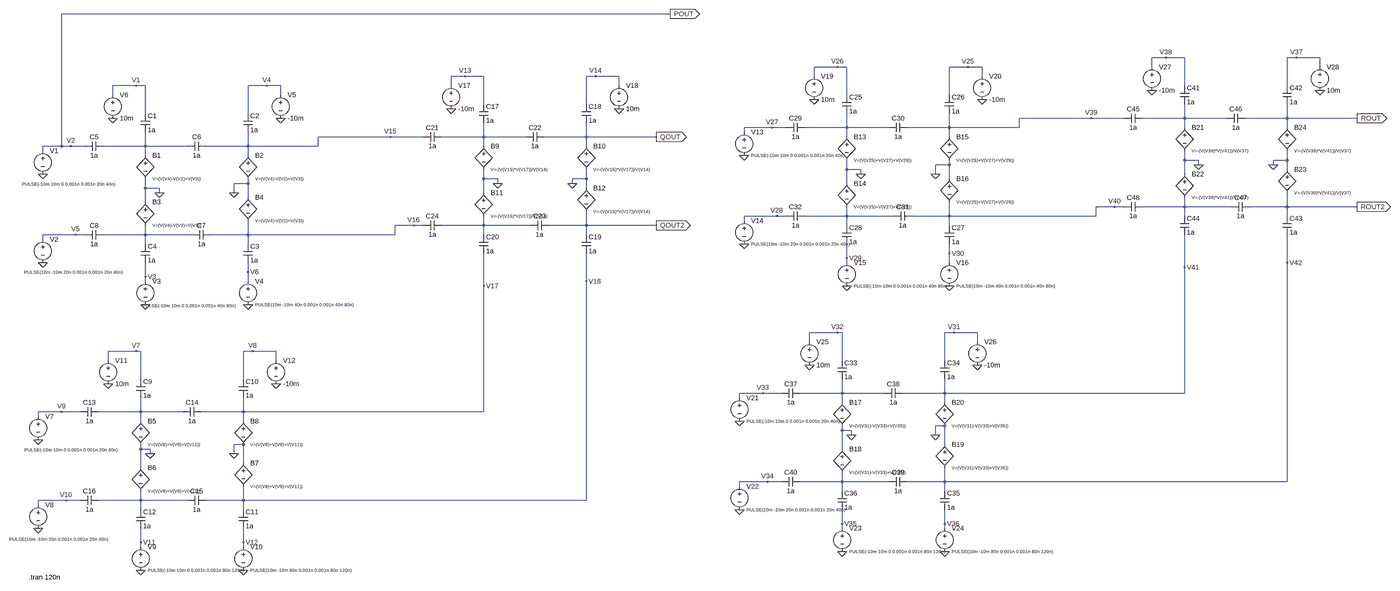
[diagram p0: schematic fredkin gate.asc, whole sheet]
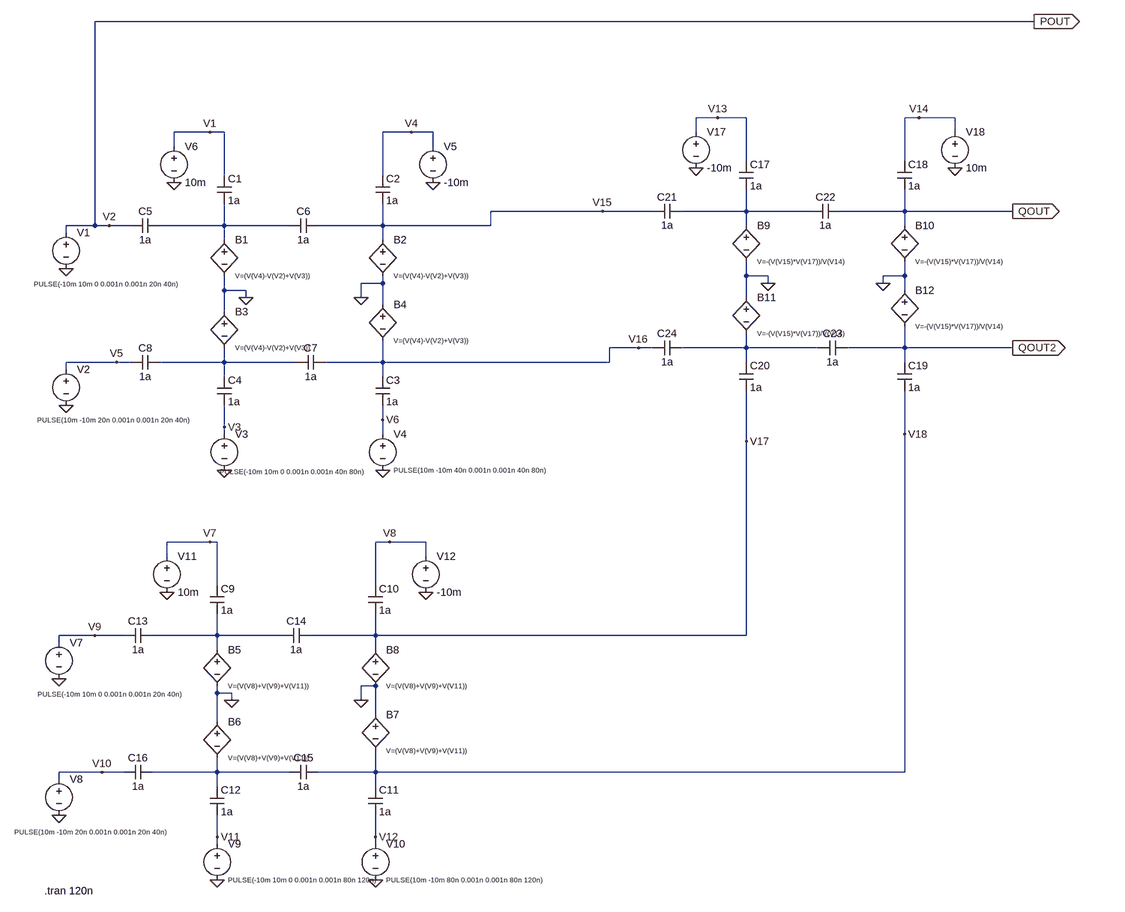
[diagram p1: schematic fredkin gate.asc, part, row 1 of 1, column 1 of 2]
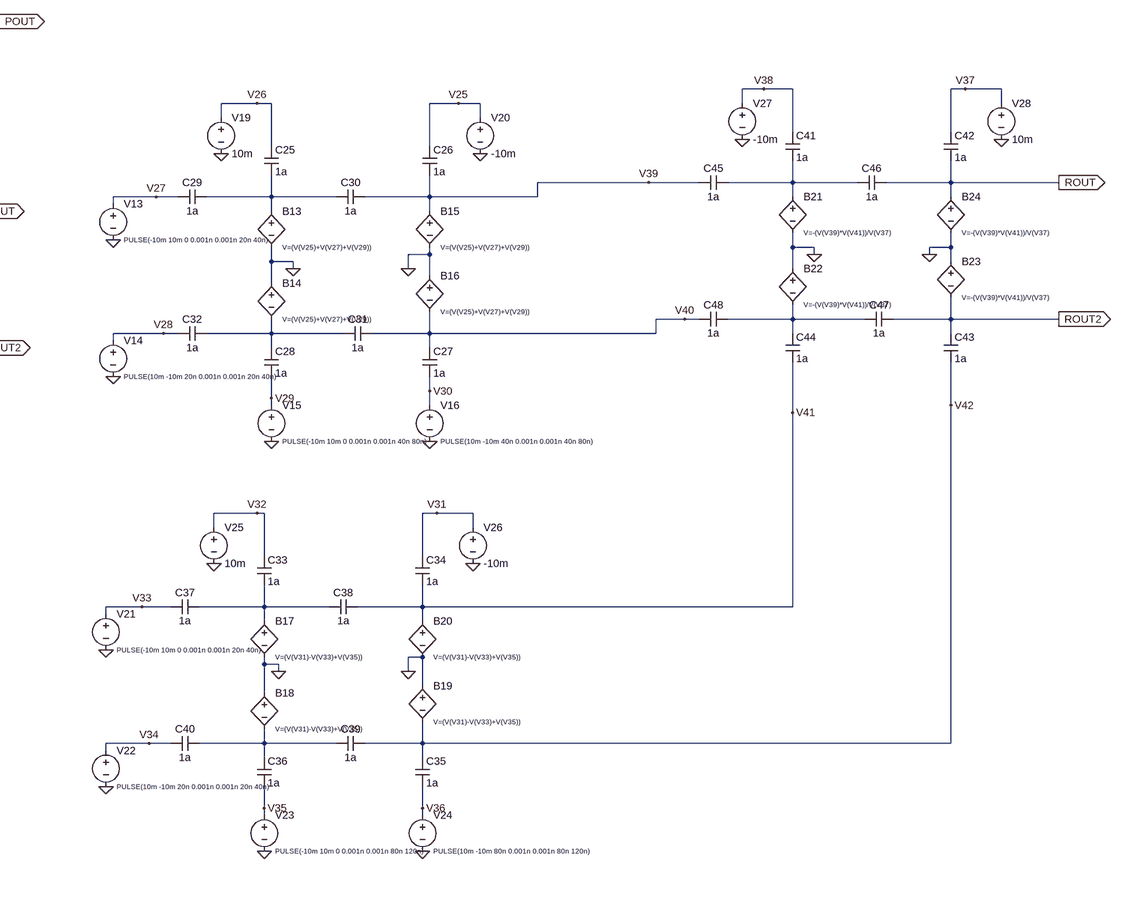
[diagram p2: schematic fredkin gate.asc, part, row 1 of 1, column 2 of 2]
fredkin gate.asc, the LTspice schematic file:
Version 4.1
SHEET 1 4316 1336
WIRE 1616 -784 -656 -784
WIRE 3520 -464 3472 -464
WIRE 3584 -464 3520 -464
WIRE 3968 -464 3936 -464
WIRE 4048 -464 3968 -464
WIRE 2208 -432 2128 -432
WIRE 2240 -432 2208 -432
WIRE 2656 -432 2592 -432
WIRE 2704 -432 2656 -432
WIRE 3472 -432 3472 -464
WIRE 4048 -432 4048 -464
WIRE 912 -400 864 -400
WIRE 976 -400 912 -400
WIRE 1360 -400 1328 -400
WIRE 1440 -400 1360 -400
WIRE 2128 -400 2128 -432
WIRE 2704 -400 2704 -432
WIRE -400 -368 -480 -368
WIRE -368 -368 -400 -368
WIRE 48 -368 -16 -368
WIRE 96 -368 48 -368
WIRE 864 -368 864 -400
WIRE 1440 -368 1440 -400
WIRE 3584 -368 3584 -464
WIRE 3936 -368 3936 -464
WIRE -480 -336 -480 -368
WIRE 96 -336 96 -368
WIRE 2240 -336 2240 -432
WIRE 2592 -336 2592 -432
WIRE 976 -304 976 -400
WIRE 1328 -304 1328 -400
WIRE -368 -272 -368 -368
WIRE -16 -272 -16 -368
WIRE 3264 -256 2832 -256
WIRE 3376 -256 3264 -256
WIRE 3584 -256 3584 -304
WIRE 3584 -256 3440 -256
WIRE 3728 -256 3584 -256
WIRE 3936 -256 3936 -304
WIRE 3936 -256 3792 -256
WIRE 4176 -256 3936 -256
WIRE 1984 -224 1888 -224
WIRE 2032 -224 1984 -224
WIRE 2240 -224 2240 -272
WIRE 2240 -224 2096 -224
WIRE 2384 -224 2240 -224
WIRE 2592 -224 2592 -272
WIRE 2592 -224 2448 -224
WIRE 2832 -224 2832 -256
WIRE 2832 -224 2592 -224
WIRE 3584 -224 3584 -256
WIRE 3936 -224 3936 -256
WIRE 1888 -208 1888 -224
WIRE 656 -192 224 -192
WIRE 768 -192 656 -192
WIRE 976 -192 976 -240
WIRE 976 -192 832 -192
WIRE 1120 -192 976 -192
WIRE 1328 -192 1328 -240
WIRE 1328 -192 1184 -192
WIRE 1568 -192 1328 -192
WIRE 2240 -192 2240 -224
WIRE 2592 -192 2592 -224
WIRE -656 -160 -656 -784
WIRE -656 -160 -720 -160
WIRE -624 -160 -656 -160
WIRE -576 -160 -624 -160
WIRE -368 -160 -368 -208
WIRE -368 -160 -512 -160
WIRE -224 -160 -368 -160
WIRE -16 -160 -16 -208
WIRE -16 -160 -160 -160
WIRE 224 -160 224 -192
WIRE 224 -160 -16 -160
WIRE 976 -160 976 -192
WIRE 1328 -160 1328 -192
WIRE -720 -144 -720 -160
WIRE -368 -128 -368 -160
WIRE -16 -128 -16 -160
WIRE 3584 -112 3584 -144
WIRE 3632 -112 3584 -112
WIRE 3936 -112 3936 -144
WIRE 3936 -112 3888 -112
WIRE 2592 -96 2592 -112
WIRE 2592 -96 2544 -96
WIRE 3632 -96 3632 -112
WIRE 3888 -96 3888 -112
WIRE 2240 -80 2240 -112
WIRE 2288 -80 2240 -80
WIRE 3936 -80 3936 -112
WIRE 2288 -64 2288 -80
WIRE 2544 -64 2544 -96
WIRE 3584 -64 3584 -112
WIRE 976 -48 976 -80
WIRE 1024 -48 976 -48
WIRE 1328 -48 1328 -80
WIRE 1328 -48 1280 -48
WIRE 2592 -48 2592 -96
WIRE -16 -32 -16 -48
WIRE -16 -32 -64 -32
WIRE 1024 -32 1024 -48
WIRE 1280 -32 1280 -48
WIRE 2240 -32 2240 -80
WIRE -368 -16 -368 -48
WIRE -320 -16 -368 -16
WIRE 1328 -16 1328 -48
WIRE -320 0 -320 -16
WIRE -64 0 -64 -32
WIRE 976 0 976 -48
WIRE -16 16 -16 -32
WIRE -368 32 -368 -16
WIRE 3344 48 3280 48
WIRE 3376 48 3344 48
WIRE 3584 48 3584 16
WIRE 3584 48 3440 48
WIRE 3744 48 3584 48
WIRE 3936 48 3936 0
WIRE 3936 48 3808 48
WIRE 4176 48 3936 48
WIRE 2000 80 1888 80
WIRE 2032 80 2000 80
WIRE 2240 80 2240 48
WIRE 2240 80 2096 80
WIRE 2400 80 2240 80
WIRE 2592 80 2592 32
WIRE 2592 80 2464 80
WIRE 3280 80 3280 48
WIRE 3280 80 2592 80
WIRE 3584 80 3584 48
WIRE 3936 80 3936 48
WIRE 1888 96 1888 80
WIRE 736 112 672 112
WIRE 768 112 736 112
WIRE 976 112 976 80
WIRE 976 112 832 112
WIRE 1136 112 976 112
WIRE 1328 112 1328 64
WIRE 1328 112 1200 112
WIRE 1568 112 1328 112
WIRE 2240 112 2240 80
WIRE 2592 112 2592 80
WIRE -608 144 -720 144
WIRE -576 144 -608 144
WIRE -368 144 -368 112
WIRE -368 144 -512 144
WIRE -208 144 -368 144
WIRE -16 144 -16 96
WIRE -16 144 -144 144
WIRE 672 144 672 112
WIRE 672 144 -16 144
WIRE 976 144 976 112
WIRE 1328 144 1328 112
WIRE -720 160 -720 144
WIRE -368 176 -368 144
WIRE -16 176 -16 144
WIRE 2592 208 2592 176
WIRE 2240 224 2240 176
WIRE 2240 240 2240 224
WIRE 2592 240 2592 208
WIRE 3936 240 3936 144
WIRE 3584 256 3584 144
WIRE -16 272 -16 240
WIRE -368 288 -368 240
WIRE -368 304 -368 288
WIRE -16 304 -16 272
WIRE 1328 304 1328 208
WIRE 976 320 976 208
WIRE 2208 480 2112 480
WIRE 2224 480 2208 480
WIRE 2608 480 2576 480
WIRE 2688 480 2608 480
WIRE 2112 512 2112 480
WIRE 2688 512 2688 480
WIRE -400 544 -496 544
WIRE -384 544 -400 544
WIRE 0 544 -32 544
WIRE 80 544 0 544
WIRE -496 576 -496 544
WIRE 80 576 80 544
WIRE 2224 576 2224 480
WIRE 2576 576 2576 480
WIRE -384 640 -384 544
WIRE -32 640 -32 544
WIRE 1952 688 1872 688
WIRE 2016 688 1952 688
WIRE 2224 688 2224 640
WIRE 2224 688 2080 688
WIRE 2368 688 2224 688
WIRE 2576 688 2576 640
WIRE 2576 688 2432 688
WIRE 3584 688 3584 256
WIRE 3584 688 2576 688
WIRE 1872 704 1872 688
WIRE 2224 720 2224 688
WIRE 2576 720 2576 688
WIRE -656 752 -736 752
WIRE -592 752 -656 752
WIRE -384 752 -384 704
WIRE -384 752 -528 752
WIRE -240 752 -384 752
WIRE -32 752 -32 704
WIRE -32 752 -176 752
WIRE 976 752 976 320
WIRE 976 752 -32 752
WIRE -736 768 -736 752
WIRE -384 784 -384 752
WIRE -32 784 -32 752
WIRE 2576 800 2544 800
WIRE 2224 816 2224 800
WIRE 2256 816 2224 816
WIRE 2256 832 2256 816
WIRE 2544 832 2544 800
WIRE -32 864 -64 864
WIRE 2576 864 2576 800
WIRE -384 880 -384 864
WIRE -352 880 -384 880
WIRE 2224 880 2224 816
WIRE -352 896 -352 880
WIRE -64 896 -64 864
WIRE -32 928 -32 864
WIRE -384 944 -384 880
WIRE 1968 992 1872 992
WIRE 2016 992 1968 992
WIRE 2224 992 2224 960
WIRE 2224 992 2080 992
WIRE 2384 992 2224 992
WIRE 2576 992 2576 944
WIRE 2576 992 2448 992
WIRE 3936 992 3936 240
WIRE 3936 992 2576 992
WIRE 1872 1008 1872 992
WIRE 2224 1024 2224 992
WIRE 2576 1024 2576 992
WIRE -640 1056 -736 1056
WIRE -592 1056 -640 1056
WIRE -384 1056 -384 1024
WIRE -384 1056 -528 1056
WIRE -224 1056 -384 1056
WIRE -32 1056 -32 1008
WIRE -32 1056 -160 1056
WIRE 1328 1056 1328 304
WIRE 1328 1056 -32 1056
WIRE -736 1072 -736 1056
WIRE -384 1088 -384 1056
WIRE -32 1088 -32 1056
WIRE 2224 1136 2224 1088
WIRE 2576 1136 2576 1088
WIRE 2224 1152 2224 1136
WIRE 2576 1152 2576 1136
WIRE -384 1200 -384 1152
WIRE -32 1200 -32 1152
WIRE -384 1216 -384 1200
WIRE -32 1216 -32 1200
FLAG -480 -256 0
FLAG -720 -64 0
FLAG -720 240 0
FLAG -368 384 0
FLAG -16 384 0
FLAG 96 -256 0
FLAG -400 -368 V1
FLAG -624 -160 V2
FLAG -608 144 V5
FLAG -368 288 V3
FLAG -16 272 V6
FLAG 48 -368 V4
FLAG -496 656 0
FLAG -736 848 0
FLAG -736 1152 0
FLAG -384 1296 0
FLAG -32 1296 0
FLAG 80 656 0
FLAG 864 -288 0
FLAG 1440 -288 0
FLAG 1568 -192 QOUT
IOPIN 1568 -192 Out
FLAG 1568 112 QOUT2
IOPIN 1568 112 Out
FLAG -400 544 V7
FLAG 0 544 V8
FLAG -656 752 V9
FLAG -640 1056 V10
FLAG -384 1200 V11
FLAG -32 1200 V12
FLAG 912 -400 V13
FLAG 1360 -400 V14
FLAG 656 -192 V15
FLAG 736 112 V16
FLAG 976 320 V17
FLAG 1328 304 V18
FLAG -320 0 0
FLAG -64 0 0
FLAG 1024 -32 0
FLAG 1280 -32 0
FLAG -352 896 0
FLAG -64 896 0
FLAG 2128 -320 0
FLAG 1888 -128 0
FLAG 1888 176 0
FLAG 2240 320 0
FLAG 2592 320 0
FLAG 2704 -320 0
FLAG 2208 -432 V26
FLAG 1984 -224 V27
FLAG 2000 80 V28
FLAG 2240 224 V29
FLAG 2592 208 V30
FLAG 2656 -432 V25
FLAG 2112 592 0
FLAG 1872 784 0
FLAG 1872 1088 0
FLAG 2224 1232 0
FLAG 2576 1232 0
FLAG 2688 592 0
FLAG 3472 -352 0
FLAG 4048 -352 0
FLAG 4176 -256 ROUT
IOPIN 4176 -256 Out
FLAG 4176 48 ROUT2
IOPIN 4176 48 Out
FLAG 2208 480 V32
FLAG 2608 480 V31
FLAG 1952 688 V33
FLAG 1968 992 V34
FLAG 2224 1136 V35
FLAG 2576 1136 V36
FLAG 3520 -464 V38
FLAG 3968 -464 V37
FLAG 3264 -256 V39
FLAG 3344 48 V40
FLAG 3584 256 V41
FLAG 3936 240 V42
FLAG 2288 -64 0
FLAG 2544 -64 0
FLAG 3632 -96 0
FLAG 3888 -96 0
FLAG 2256 832 0
FLAG 2544 832 0
FLAG 1616 -784 POUT
IOPIN 1616 -784 Out
SYMBOL bv -368 -144 R0
WINDOW 3 24 96 Left 1
SYMATTR Value V=(V(V4)-V(V2)+V(V3))
SYMATTR InstName B1
SYMBOL bv -16 -144 R0
WINDOW 3 24 96 Left 1
SYMATTR Value V=(V(V4)-V(V2)+V(V3))
SYMATTR InstName B2
SYMBOL bv -368 16 R0
WINDOW 3 24 96 Left 1
SYMATTR Value V=(V(V4)-V(V2)+V(V3))
SYMATTR InstName B3
SYMBOL bv -16 0 R0
WINDOW 3 24 96 Left 1
SYMATTR Value V=(V(V4)-V(V2)+V(V3))
SYMATTR InstName B4
SYMBOL cap -384 -272 R0
SYMATTR InstName C1
SYMATTR Value 1a
SYMBOL cap -32 -272 R0
SYMATTR InstName C2
SYMATTR Value 1a
SYMBOL cap -32 176 R0
SYMATTR InstName C3
SYMATTR Value 1a
SYMBOL cap -384 176 R0
SYMATTR InstName C4
SYMATTR Value 1a
SYMBOL cap -512 -176 R90
WINDOW 0 0 32 VBottom 2
WINDOW 3 32 32 VTop 2
SYMATTR InstName C5
SYMATTR Value 1a
SYMBOL cap -160 -176 R90
WINDOW 0 0 32 VBottom 2
WINDOW 3 32 32 VTop 2
SYMATTR InstName C6
SYMATTR Value 1a
SYMBOL cap -144 128 R90
WINDOW 0 0 32 VBottom 2
WINDOW 3 32 32 VTop 2
SYMATTR InstName C7
SYMATTR Value 1a
SYMBOL cap -512 128 R90
WINDOW 0 0 32 VBottom 2
WINDOW 3 32 32 VTop 2
SYMATTR InstName C8
SYMATTR Value 1a
SYMBOL voltage -720 -160 R0
WINDOW 3 -72 130 Left 1
WINDOW 123 0 0 Left 0
WINDOW 39 0 0 Left 0
SYMATTR Value PULSE(-10m 10m 0 0.001n 0.001n 20n 40n)
SYMATTR InstName V1
SYMBOL voltage -720 144 R0
WINDOW 3 -64 129 Left 1
WINDOW 123 0 0 Left 0
WINDOW 39 0 0 Left 0
SYMATTR Value PULSE(10m -10m 20n 0.001n 0.001n 20n 40n)
SYMATTR InstName V2
SYMBOL voltage -368 288 R0
WINDOW 3 -10 100 Left 1
WINDOW 123 0 0 Left 0
WINDOW 39 0 0 Left 0
SYMATTR Value PULSE(-10m 10m 0 0.001n 0.001n 40n 80n)
SYMATTR InstName V3
SYMBOL voltage -16 288 R0
WINDOW 3 24 96 Left 1
WINDOW 123 0 0 Left 0
WINDOW 39 0 0 Left 0
SYMATTR Value PULSE(10m -10m 40n 0.001n 0.001n 40n 80n)
SYMATTR InstName V4
SYMBOL voltage -480 -352 R0
WINDOW 123 0 0 Left 0
WINDOW 39 0 0 Left 0
SYMATTR InstName V6
SYMATTR Value 10m
SYMBOL voltage 96 -352 R0
WINDOW 123 0 0 Left 0
WINDOW 39 0 0 Left 0
SYMATTR InstName V5
SYMATTR Value -10m
SYMBOL bv -384 768 R0
WINDOW 3 24 96 Left 1
SYMATTR Value V=(V(V8)+V(V9)+V(V11))
SYMATTR InstName B5
SYMBOL cap -400 640 R0
SYMATTR InstName C9
SYMATTR Value 1a
SYMBOL cap -48 640 R0
SYMATTR InstName C10
SYMATTR Value 1a
SYMBOL cap -48 1088 R0
SYMATTR InstName C11
SYMATTR Value 1a
SYMBOL cap -400 1088 R0
SYMATTR InstName C12
SYMATTR Value 1a
SYMBOL cap -528 736 R90
WINDOW 0 0 32 VBottom 2
WINDOW 3 32 32 VTop 2
SYMATTR InstName C13
SYMATTR Value 1a
SYMBOL cap -176 736 R90
WINDOW 0 0 32 VBottom 2
WINDOW 3 32 32 VTop 2
SYMATTR InstName C14
SYMATTR Value 1a
SYMBOL cap -160 1040 R90
WINDOW 0 0 32 VBottom 2
WINDOW 3 32 32 VTop 2
SYMATTR InstName C15
SYMATTR Value 1a
SYMBOL cap -528 1040 R90
WINDOW 0 0 32 VBottom 2
WINDOW 3 32 32 VTop 2
SYMATTR InstName C16
SYMATTR Value 1a
SYMBOL voltage -736 752 R0
WINDOW 3 -47 131 Left 1
WINDOW 123 0 0 Left 0
WINDOW 39 0 0 Left 0
SYMATTR Value PULSE(-10m 10m 0 0.001n 0.001n 20n 40n)
SYMATTR InstName V7
SYMBOL voltage -736 1056 R0
WINDOW 3 -99 133 Left 1
WINDOW 123 0 0 Left 0
WINDOW 39 0 0 Left 0
SYMATTR Value PULSE(10m -10m 20n 0.001n 0.001n 20n 40n)
SYMATTR InstName V8
SYMBOL voltage -384 1200 R0
WINDOW 3 24 96 Left 1
WINDOW 123 0 0 Left 0
WINDOW 39 0 0 Left 0
SYMATTR Value PULSE(-10m 10m 0 0.001n 0.001n 80n 120n)
SYMATTR InstName V9
SYMBOL voltage -32 1200 R0
WINDOW 3 24 96 Left 1
WINDOW 123 0 0 Left 0
WINDOW 39 0 0 Left 0
SYMATTR Value PULSE(10m -10m 80n 0.001n 0.001n 80n 120n)
SYMATTR InstName V10
SYMBOL voltage -496 560 R0
WINDOW 123 0 0 Left 0
WINDOW 39 0 0 Left 0
SYMATTR InstName V11
SYMATTR Value 10m
SYMBOL voltage 80 560 R0
WINDOW 123 0 0 Left 0
WINDOW 39 0 0 Left 0
SYMATTR InstName V12
SYMATTR Value -10m
SYMBOL bv 976 -176 R0
WINDOW 3 24 96 Left 1
SYMATTR Value V=-(V(V15)*V(V17))/V(V14)
SYMATTR InstName B9
SYMBOL bv 1328 -176 R0
WINDOW 3 24 96 Left 1
SYMATTR Value V=-(V(V15)*V(V17))/V(V14)
SYMATTR InstName B10
SYMBOL bv 976 -16 R0
WINDOW 3 24 96 Left 1
SYMATTR Value V=-(V(V15)*V(V17))/V(V14)
SYMATTR InstName B11
SYMBOL bv 1328 -32 R0
WINDOW 3 24 96 Left 1
SYMATTR Value V=-(V(V15)*V(V17))/V(V14)
SYMATTR InstName B12
SYMBOL cap 960 -304 R0
SYMATTR InstName C17
SYMATTR Value 1a
SYMBOL cap 1312 -304 R0
SYMATTR InstName C18
SYMATTR Value 1a
SYMBOL cap 1312 144 R0
SYMATTR InstName C19
SYMATTR Value 1a
SYMBOL cap 960 144 R0
SYMATTR InstName C20
SYMATTR Value 1a
SYMBOL cap 832 -208 R90
WINDOW 0 0 32 VBottom 2
WINDOW 3 32 32 VTop 2
SYMATTR InstName C21
SYMATTR Value 1a
SYMBOL cap 1184 -208 R90
WINDOW 0 0 32 VBottom 2
WINDOW 3 32 32 VTop 2
SYMATTR InstName C22
SYMATTR Value 1a
SYMBOL cap 1200 96 R90
WINDOW 0 0 32 VBottom 2
WINDOW 3 32 32 VTop 2
SYMATTR InstName C23
SYMATTR Value 1a
SYMBOL cap 832 96 R90
WINDOW 0 0 32 VBottom 2
WINDOW 3 32 32 VTop 2
SYMATTR InstName C24
SYMATTR Value 1a
SYMBOL voltage 864 -384 R0
WINDOW 123 0 0 Left 0
WINDOW 39 0 0 Left 0
SYMATTR InstName V17
SYMATTR Value -10m
SYMBOL voltage 1440 -384 R0
WINDOW 123 0 0 Left 0
WINDOW 39 0 0 Left 0
SYMATTR InstName V18
SYMATTR Value 10m
SYMBOL bv 2240 -208 R0
WINDOW 3 24 96 Left 1
SYMATTR Value V=(V(V25)+V(V27)+V(V29))
SYMATTR InstName B13
SYMBOL cap 2224 -336 R0
SYMATTR InstName C25
SYMATTR Value 1a
SYMBOL cap 2576 -336 R0
SYMATTR InstName C26
SYMATTR Value 1a
SYMBOL cap 2576 112 R0
SYMATTR InstName C27
SYMATTR Value 1a
SYMBOL cap 2224 112 R0
SYMATTR InstName C28
SYMATTR Value 1a
SYMBOL cap 2096 -240 R90
WINDOW 0 0 32 VBottom 2
WINDOW 3 32 32 VTop 2
SYMATTR InstName C29
SYMATTR Value 1a
SYMBOL cap 2448 -240 R90
WINDOW 0 0 32 VBottom 2
WINDOW 3 32 32 VTop 2
SYMATTR InstName C30
SYMATTR Value 1a
SYMBOL cap 2464 64 R90
WINDOW 0 0 32 VBottom 2
WINDOW 3 32 32 VTop 2
SYMATTR InstName C31
SYMATTR Value 1a
SYMBOL cap 2096 64 R90
WINDOW 0 0 32 VBottom 2
WINDOW 3 32 32 VTop 2
SYMATTR InstName C32
SYMATTR Value 1a
SYMBOL voltage 1888 -224 R0
WINDOW 3 24 96 Left 1
WINDOW 123 0 0 Left 0
WINDOW 39 0 0 Left 0
SYMATTR Value PULSE(-10m 10m 0 0.001n 0.001n 20n 40n)
SYMATTR InstName V13
SYMBOL voltage 1888 80 R0
WINDOW 3 24 96 Left 1
WINDOW 123 0 0 Left 0
WINDOW 39 0 0 Left 0
SYMATTR Value PULSE(10m -10m 20n 0.001n 0.001n 20n 40n)
SYMATTR InstName V14
SYMBOL voltage 2240 224 R0
WINDOW 3 24 96 Left 1
WINDOW 123 0 0 Left 0
WINDOW 39 0 0 Left 0
SYMATTR Value PULSE(-10m 10m 0 0.001n 0.001n 40n 80n)
SYMATTR InstName V15
SYMBOL voltage 2592 224 R0
WINDOW 3 24 96 Left 1
WINDOW 123 0 0 Left 0
WINDOW 39 0 0 Left 0
SYMATTR Value PULSE(10m -10m 40n 0.001n 0.001n 40n 80n)
SYMATTR InstName V16
SYMBOL voltage 2128 -416 R0
WINDOW 123 0 0 Left 0
WINDOW 39 0 0 Left 0
SYMATTR InstName V19
SYMATTR Value 10m
SYMBOL voltage 2704 -416 R0
WINDOW 123 0 0 Left 0
WINDOW 39 0 0 Left 0
SYMATTR InstName V20
SYMATTR Value -10m
SYMBOL bv 2224 704 R0
WINDOW 3 24 96 Left 1
SYMATTR Value V=(V(V31)-V(V33)+V(V35))
SYMATTR InstName B17
SYMBOL cap 2208 576 R0
SYMATTR InstName C33
SYMATTR Value 1a
SYMBOL cap 2560 576 R0
SYMATTR InstName C34
SYMATTR Value 1a
SYMBOL cap 2560 1024 R0
SYMATTR InstName C35
SYMATTR Value 1a
SYMBOL cap 2208 1024 R0
SYMATTR InstName C36
SYMATTR Value 1a
SYMBOL cap 2080 672 R90
WINDOW 0 0 32 VBottom 2
WINDOW 3 32 32 VTop 2
SYMATTR InstName C37
SYMATTR Value 1a
SYMBOL cap 2432 672 R90
WINDOW 0 0 32 VBottom 2
WINDOW 3 32 32 VTop 2
SYMATTR InstName C38
SYMATTR Value 1a
SYMBOL cap 2448 976 R90
WINDOW 0 0 32 VBottom 2
WINDOW 3 32 32 VTop 2
SYMATTR InstName C39
SYMATTR Value 1a
SYMBOL cap 2080 976 R90
WINDOW 0 0 32 VBottom 2
WINDOW 3 32 32 VTop 2
SYMATTR InstName C40
SYMATTR Value 1a
SYMBOL voltage 1872 688 R0
WINDOW 3 24 96 Left 1
WINDOW 123 0 0 Left 0
WINDOW 39 0 0 Left 0
SYMATTR Value PULSE(-10m 10m 0 0.001n 0.001n 20n 40n)
SYMATTR InstName V21
SYMBOL voltage 1872 992 R0
WINDOW 3 24 96 Left 1
WINDOW 123 0 0 Left 0
WINDOW 39 0 0 Left 0
SYMATTR Value PULSE(10m -10m 20n 0.001n 0.001n 20n 40n)
SYMATTR InstName V22
SYMBOL voltage 2224 1136 R0
WINDOW 3 24 96 Left 1
WINDOW 123 0 0 Left 0
WINDOW 39 0 0 Left 0
SYMATTR Value PULSE(-10m 10m 0 0.001n 0.001n 80n 120n)
SYMATTR InstName V23
SYMBOL voltage 2576 1136 R0
WINDOW 3 24 96 Left 1
WINDOW 123 0 0 Left 0
WINDOW 39 0 0 Left 0
SYMATTR Value PULSE(10m -10m 80n 0.001n 0.001n 80n 120n)
SYMATTR InstName V24
SYMBOL voltage 2112 496 R0
WINDOW 123 0 0 Left 0
WINDOW 39 0 0 Left 0
SYMATTR InstName V25
SYMATTR Value 10m
SYMBOL voltage 2688 496 R0
WINDOW 123 0 0 Left 0
WINDOW 39 0 0 Left 0
SYMATTR InstName V26
SYMATTR Value -10m
SYMBOL bv 3584 -240 R0
WINDOW 3 24 96 Left 1
SYMATTR Value V=-(V(V39)*V(V41))/V(V37)
SYMATTR InstName B21
SYMBOL cap 3568 -368 R0
SYMATTR InstName C41
SYMATTR Value 1a
SYMBOL cap 3920 -368 R0
SYMATTR InstName C42
SYMATTR Value 1a
SYMBOL cap 3920 80 R0
SYMATTR InstName C43
SYMATTR Value 1a
SYMBOL cap 3568 80 R0
SYMATTR InstName C44
SYMATTR Value 1a
SYMBOL cap 3440 -272 R90
WINDOW 0 0 32 VBottom 2
WINDOW 3 32 32 VTop 2
SYMATTR InstName C45
SYMATTR Value 1a
SYMBOL cap 3792 -272 R90
WINDOW 0 0 32 VBottom 2
WINDOW 3 32 32 VTop 2
SYMATTR InstName C46
SYMATTR Value 1a
SYMBOL cap 3808 32 R90
WINDOW 0 0 32 VBottom 2
WINDOW 3 32 32 VTop 2
SYMATTR InstName C47
SYMATTR Value 1a
SYMBOL cap 3440 32 R90
WINDOW 0 0 32 VBottom 2
WINDOW 3 32 32 VTop 2
SYMATTR InstName C48
SYMATTR Value 1a
SYMBOL voltage 3472 -448 R0
WINDOW 123 0 0 Left 0
WINDOW 39 0 0 Left 0
SYMATTR InstName V27
SYMATTR Value -10m
SYMBOL voltage 4048 -448 R0
WINDOW 123 0 0 Left 0
WINDOW 39 0 0 Left 0
SYMATTR InstName V28
SYMATTR Value 10m
SYMBOL bv -384 928 R0
WINDOW 3 24 96 Left 1
SYMATTR Value V=(V(V8)+V(V9)+V(V11))
SYMATTR InstName B6
SYMBOL bv -32 912 R0
WINDOW 3 24 96 Left 1
SYMATTR Value V=(V(V8)+V(V9)+V(V11))
SYMATTR InstName B7
SYMBOL bv -32 768 R0
WINDOW 3 24 96 Left 1
SYMATTR Value V=(V(V8)+V(V9)+V(V11))
SYMATTR InstName B8
SYMBOL bv 2240 -48 R0
WINDOW 3 24 96 Left 1
SYMATTR Value V=(V(V25)+V(V27)+V(V29))
SYMATTR InstName B14
SYMBOL bv 2592 -208 R0
WINDOW 3 24 96 Left 1
SYMATTR Value V=(V(V25)+V(V27)+V(V29))
SYMATTR InstName B15
SYMBOL bv 2592 -64 R0
WINDOW 3 24 96 Left 1
SYMATTR Value V=(V(V25)+V(V27)+V(V29))
SYMATTR InstName B16
SYMBOL bv 2224 864 R0
WINDOW 3 24 96 Left 1
SYMATTR Value V=(V(V31)-V(V33)+V(V35))
SYMATTR InstName B18
SYMBOL bv 2576 848 R0
WINDOW 3 24 96 Left 1
SYMATTR Value V=(V(V31)-V(V33)+V(V35))
SYMATTR InstName B19
SYMBOL bv 2576 704 R0
WINDOW 3 24 96 Left 1
SYMATTR Value V=(V(V31)-V(V33)+V(V35))
SYMATTR InstName B20
SYMBOL bv 3584 -80 R0
WINDOW 3 24 96 Left 1
SYMATTR Value V=-(V(V39)*V(V41))/V(V37)
SYMATTR InstName B22
SYMBOL bv 3936 -96 R0
WINDOW 3 24 96 Left 1
SYMATTR Value V=-(V(V39)*V(V41))/V(V37)
SYMATTR InstName B23
SYMBOL bv 3936 -240 R0
WINDOW 3 24 96 Left 1
SYMATTR Value V=-(V(V39)*V(V41))/V(V37)
SYMATTR InstName B24
TEXT -768 1320 Left 2 !.tran 120n

The netlist it stands for:
* fredkin gate.asc
B1 N004 0 V=(V(V4)-V(V2)+V(V3))
B2 V15 0 V=(V(V4)-V(V2)+V(V3))
B3 0 N008 V=(V(V4)-V(V2)+V(V3))
B4 0 V16 V=(V(V4)-V(V2)+V(V3))
C1 V1 N004 1a
C2 V4 V15 1a
C3 V16 V6 1a
C4 N008 V3 1a
C5 N004 POUT 1a
C6 V15 N004 1a
C7 V16 N008 1a
C8 N008 V5 1a
V1 POUT 0 PULSE(-10m 10m 0 0.001n 0.001n 20n 40n)
V2 V5 0 PULSE(10m -10m 20n 0.001n 0.001n 20n 40n)
V3 V3 0 PULSE(-10m 10m 0 0.001n 0.001n 40n 80n)
V4 V6 0 PULSE(10m -10m 40n 0.001n 0.001n 40n 80n)
V6 V1 0 10m
V5 V4 0 -10m
B5 N010 0 V=(V(V8)+V(V9)+V(V11))
C9 V7 N010 1a
C10 V8 V17 1a
C11 V18 V12 1a
C12 N012 V11 1a
C13 N010 V9 1a
C14 V17 N010 1a
C15 V18 N012 1a
C16 N012 V10 1a
V7 V9 0 PULSE(-10m 10m 0 0.001n 0.001n 20n 40n)
V8 V10 0 PULSE(10m -10m 20n 0.001n 0.001n 20n 40n)
V9 V11 0 PULSE(-10m 10m 0 0.001n 0.001n 80n 120n)
V10 V12 0 PULSE(10m -10m 80n 0.001n 0.001n 80n 120n)
V11 V7 0 10m
V12 V8 0 -10m
B9 N003 0 V=-(V(V15)*V(V17))/V(V14)
B10 QOUT 0 V=-(V(V15)*V(V17))/V(V14)
B11 0 N007 V=-(V(V15)*V(V17))/V(V14)
B12 0 QOUT2 V=-(V(V15)*V(V17))/V(V14)
C17 V13 N003 1a
C18 V14 QOUT 1a
C19 QOUT2 V18 1a
C20 N007 V17 1a
C21 N003 V15 1a
C22 QOUT N003 1a
C23 QOUT2 N007 1a
C24 N007 V16 1a
V17 V13 0 -10m
V18 V14 0 10m
B13 N002 0 V=(V(V25)+V(V27)+V(V29))
C25 V26 N002 1a
C26 V25 V39 1a
C27 V40 V30 1a
C28 N006 V29 1a
C29 N002 V27 1a
C30 V39 N002 1a
C31 V40 N006 1a
C32 N006 V28 1a
V13 V27 0 PULSE(-10m 10m 0 0.001n 0.001n 20n 40n)
V14 V28 0 PULSE(10m -10m 20n 0.001n 0.001n 20n 40n)
V15 V29 0 PULSE(-10m 10m 0 0.001n 0.001n 40n 80n)
V16 V30 0 PULSE(10m -10m 40n 0.001n 0.001n 40n 80n)
V19 V26 0 10m
V20 V25 0 -10m
B17 N009 0 V=(V(V31)-V(V33)+V(V35))
C33 V32 N009 1a
C34 V31 V41 1a
C35 V42 V36 1a
C36 N011 V35 1a
C37 N009 V33 1a
C38 V41 N009 1a
C39 V42 N011 1a
C40 N011 V34 1a
V21 V33 0 PULSE(-10m 10m 0 0.001n 0.001n 20n 40n)
V22 V34 0 PULSE(10m -10m 20n 0.001n 0.001n 20n 40n)
V23 V35 0 PULSE(-10m 10m 0 0.001n 0.001n 80n 120n)
V24 V36 0 PULSE(10m -10m 80n 0.001n 0.001n 80n 120n)
V25 V32 0 10m
V26 V31 0 -10m
B21 N001 0 V=-(V(V39)*V(V41))/V(V37)
C41 V38 N001 1a
C42 V37 ROUT 1a
C43 ROUT2 V42 1a
C44 N005 V41 1a
C45 N001 V39 1a
C46 ROUT N001 1a
C47 ROUT2 N005 1a
C48 N005 V40 1a
V27 V38 0 -10m
V28 V37 0 10m
B6 0 N012 V=(V(V8)+V(V9)+V(V11))
B7 0 V18 V=(V(V8)+V(V9)+V(V11))
B8 V17 0 V=(V(V8)+V(V9)+V(V11))
B14 0 N006 V=(V(V25)+V(V27)+V(V29))
B15 V39 0 V=(V(V25)+V(V27)+V(V29))
B16 0 V40 V=(V(V25)+V(V27)+V(V29))
B18 0 N011 V=(V(V31)-V(V33)+V(V35))
B19 0 V42 V=(V(V31)-V(V33)+V(V35))
B20 V41 0 V=(V(V31)-V(V33)+V(V35))
B22 0 N005 V=-(V(V39)*V(V41))/V(V37)
B23 0 ROUT2 V=-(V(V39)*V(V41))/V(V37)
B24 ROUT 0 V=-(V(V39)*V(V41))/V(V37)
.tran 120n
.backanno
.end